# Altium project Fliptris.PrjPcb
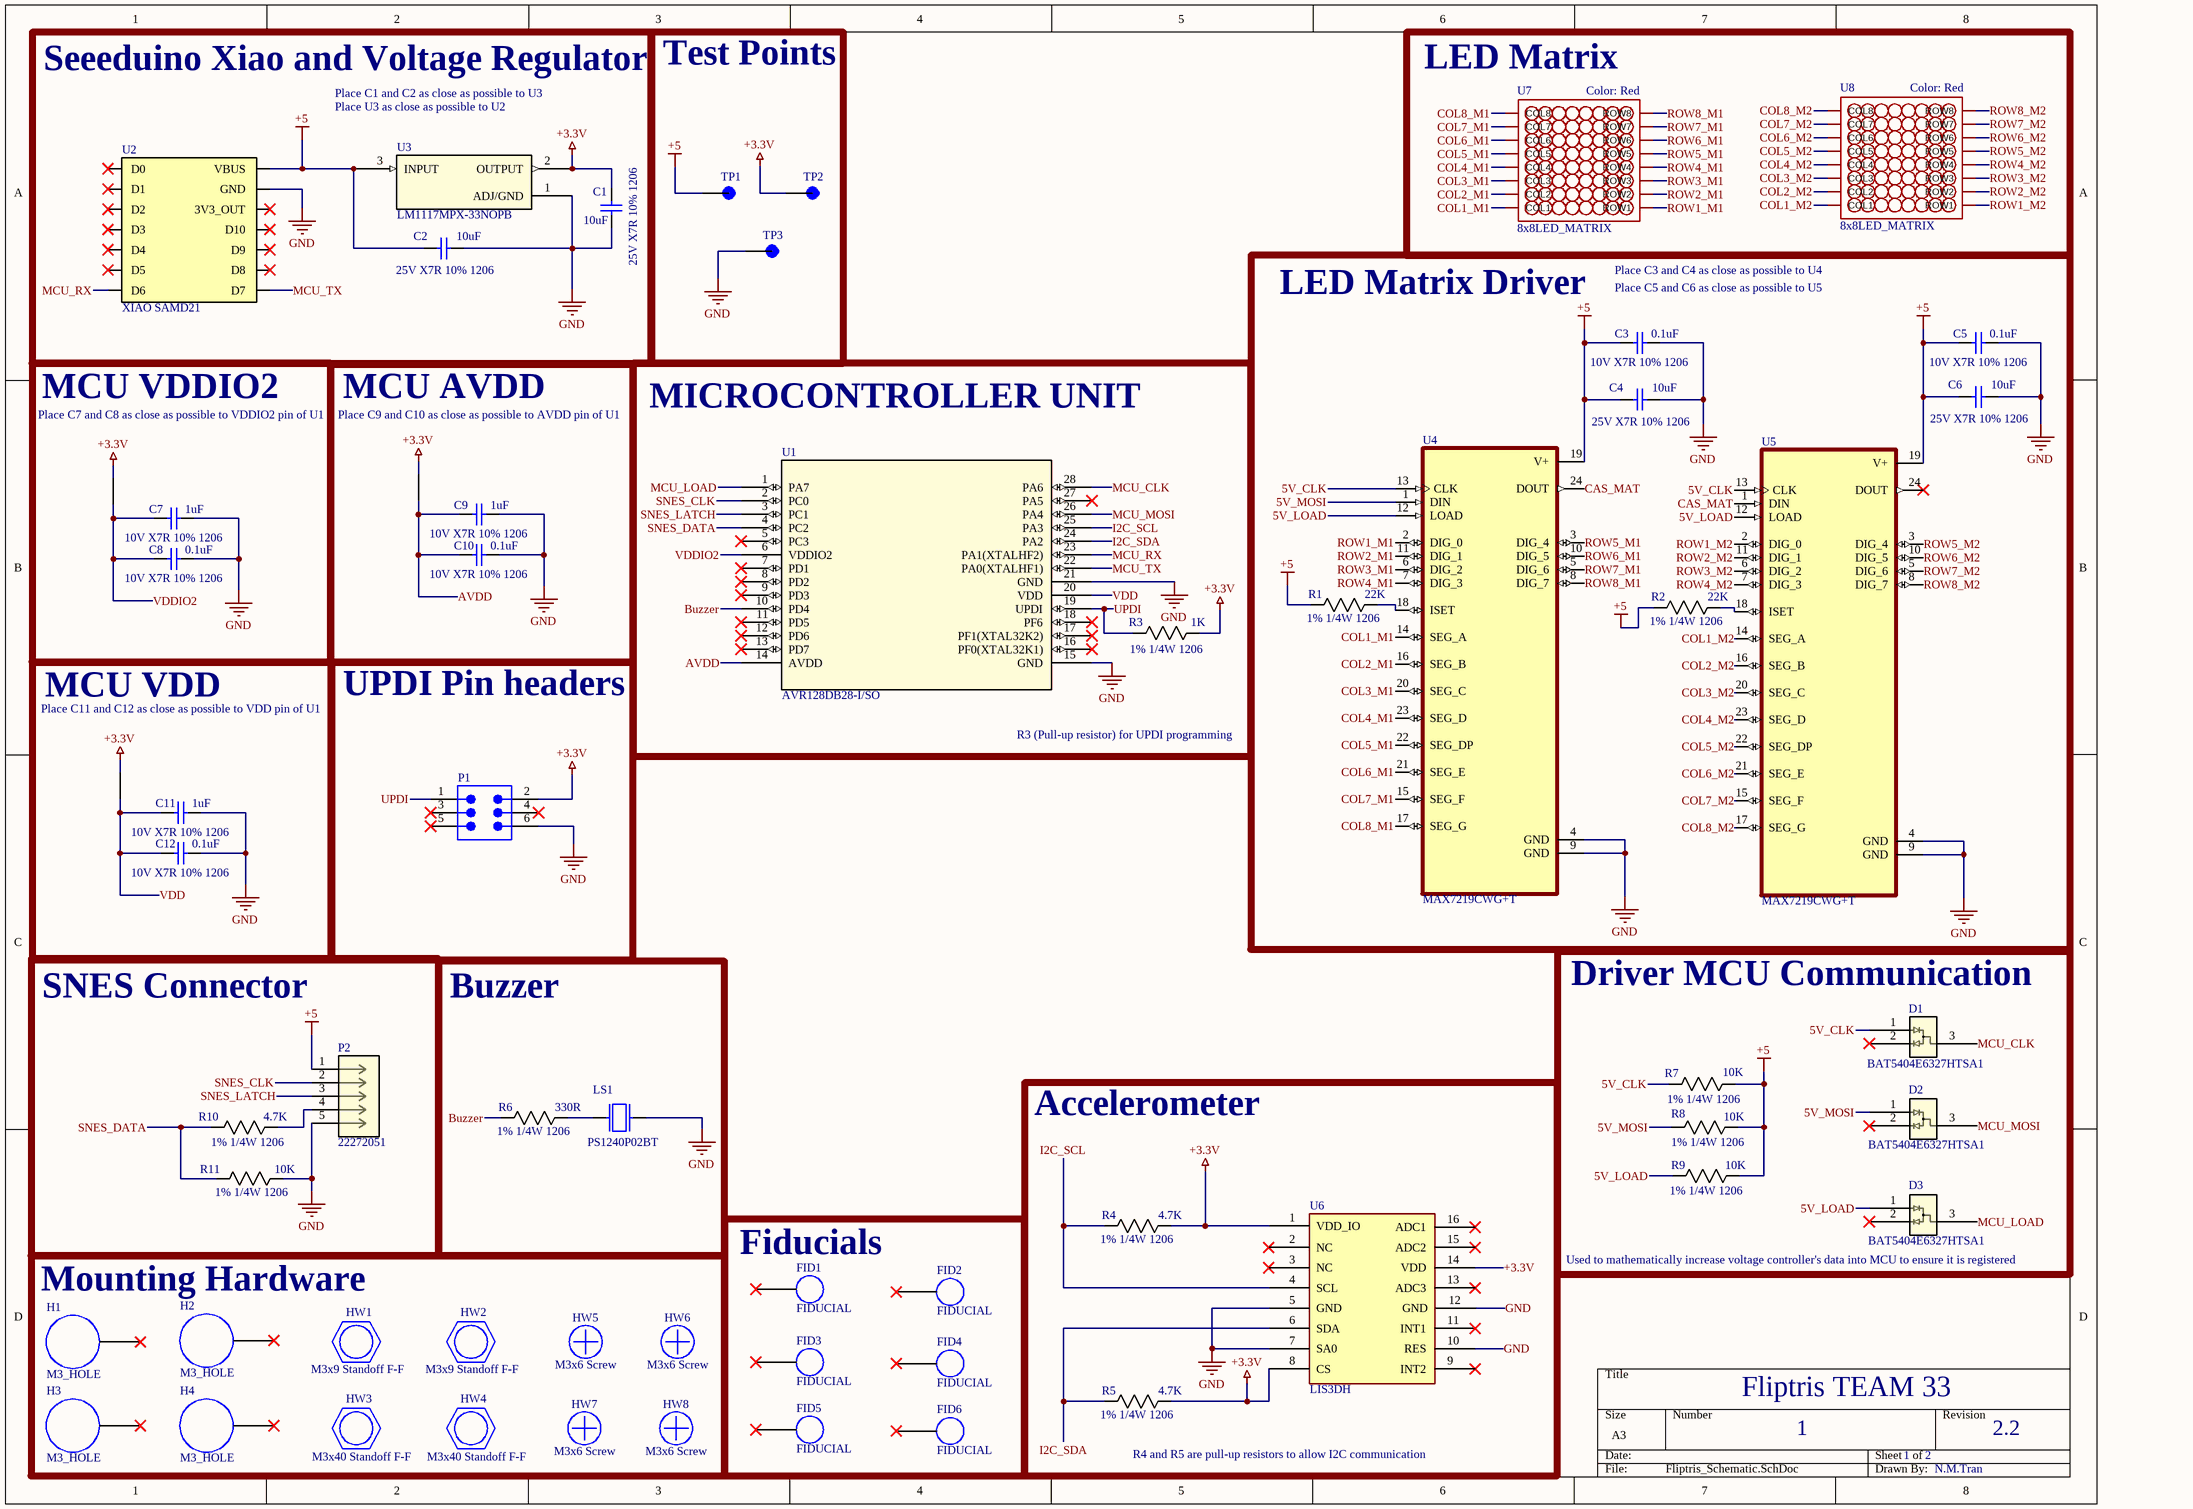
[diagram p0: Fliptris_Schematic.SchDoc]
2 sheets, 61 parts. Net scope: global (net labels, ports and power ports of the same name join across sheets).
Board file: Fliptris_PCB.PcbDoc
Sheets:
  Fliptris_Schematic.SchDoc
  Fliptris_Schematic2.SchDoc

## Sheet Fliptris_Schematic.SchDoc
size A3; SheetNumber: 1; SheetTotal: 1

### Parts
C1  25V X7R 10% 1206  value 10uF  [WCAP-CSGP_1206_L3.2W1.6H0.8]
C2  25V X7R 10% 1206  value 10uF  [WCAP-CSGP_1206_L3.2W1.6H0.8]
C3  10V X7R 10% 1206  value 0.1uF  [WCAP-CSGP_1206_L3.2W1.6H0.8]
C4  25V X7R 10% 1206  value 10uF  [WCAP-CSGP_1206_L3.2W1.6H0.8]
C5  10V X7R 10% 1206  value 0.1uF  [WCAP-CSGP_1206_L3.2W1.6H0.8]
C6  25V X7R 10% 1206  value 10uF  [WCAP-CSGP_1206_L3.2W1.6H0.8]
C7  10V X7R 10% 1206  value 1uF  [WCAP-CSGP_1206_L3.2W1.6H0.8]
C8  10V X7R 10% 1206  value 0.1uF  [WCAP-CSGP_1206_L3.2W1.6H0.8]
C9  10V X7R 10% 1206  value 1uF  [WCAP-CSGP_1206_L3.2W1.6H0.8]
C10  10V X7R 10% 1206  value 0.1uF  [WCAP-CSGP_1206_L3.2W1.6H0.8]
C11  10V X7R 10% 1206  value 1uF  [WCAP-CSGP_1206_L3.2W1.6H0.8]
C12  10V X7R 10% 1206  value 0.1uF  [WCAP-CSGP_1206_L3.2W1.6H0.8]
D1  BAT5404E6327HTSA1  [SOT23_INF]
D2  BAT5404E6327HTSA1  [SOT23_INF]
D3  BAT5404E6327HTSA1  [SOT23_INF]
FID1  FIDUCIAL  [FIDUCIAL_1.5MM]
FID2  FIDUCIAL  [FIDUCIAL_1.5MM]
FID3  FIDUCIAL  [FIDUCIAL_1.5MM]
FID4  FIDUCIAL  [FIDUCIAL_1.5MM]
FID5  FIDUCIAL  [FIDUCIAL_1.5MM]
FID6  FIDUCIAL  [FIDUCIAL_1.5MM]
H1  M3_HOLE  [M3_MOUNTING_HOLE]
H2  M3_HOLE  [M3_MOUNTING_HOLE]
H3  M3_HOLE  [M3_MOUNTING_HOLE]
H4  M3_HOLE  [M3_MOUNTING_HOLE]
HW1  M3x9 Standoff F-F
HW2  M3x9 Standoff F-F
HW3  M3x40 Standoff F-F
HW4  M3x40 Standoff F-F
HW5  M3x6 Screw
HW6  M3x6 Screw
HW7  M3x6 Screw
HW8  M3x6 Screw
LS1  PS1240P02BT  [XDCR_PS1240P02BT]
N1  NET_TIE  [NET_TIE]  (value not drawn)  (net tie, no BOM)
N2  NET_TIE  [NET_TIE]  (value not drawn)  (net tie, no BOM)
N3  NET_TIE  [NET_TIE]  (value not drawn)  (net tie, no BOM)
P1  61200621621  [61200621621]  (value not drawn)
P2  22272051  [CONN_AE-6410-05A_MOL]
R1  1% 1/4W 1206  value 22K  [Universal resistor SMD]
R2  1% 1/4W 1206  value 22K  [Universal resistor SMD]
R3  1% 1/4W 1206  value 1K  [Universal resistor SMD]
R4  1% 1/4W 1206  value 4.7K  [Universal resistor SMD]
R5  1% 1/4W 1206  value 4.7K  [Universal resistor SMD]
R6  1% 1/4W 1206  value 330R  [Universal resistor SMD]
R7  1% 1/4W 1206  value 10K  [Universal resistor SMD]
R8  1% 1/4W 1206  value 10K  [Universal resistor SMD]
R9  1% 1/4W 1206  value 10K  [Universal resistor SMD]
R10  1% 1/4W 1206  value 4.7K  [Universal resistor SMD]
R11  1% 1/4W 1206  value 10K  [Universal resistor SMD]
TP1  5010  [TP_5010]  (value not drawn)
TP2  5014  [TP_5014]  (value not drawn)
TP3  5011  [TP_5011]  (value not drawn)
U1  AVR128DB28-I/SO  [SOIC28_SO_MCH]
U2  XIAO SAMD21  [XIAO-14P-Add-On]
U3  LM1117MPX-33NOPB  [SOT223-318H_OSI]
U4  MAX7219CWG+T  [SOIC127P1032X265-24N]
U5  MAX7219CWG+T  [SOIC127P1032X265-24N]
U6  LIS3DH  [LIS3DH]
U7  8x8LED_MATRIX  [8x8LED_MATRIX]
U8  8x8LED_MATRIX  [8x8LED_MATRIX]

### Blocks framed on the sheet
Seeeduino Xiao and Voltage Regulator: C1 C2 U2 U3
Test Points: TP1-TP3
LED Matrix: U7 U8
LED Matrix Driver: C3-C6 R1 R2 U4 U5
MCU VDDIO2: C7 C8 N2
MCU AVDD: C9 C10 N1
MICROCONTROLLER UNIT: R3 U1
MCU VDD: C11 C12 N3
UPDI Pin headers: P1
SNES Connector: P2 R10 R11
Buzzer: LS1 R6
Driver MCU Communication: D1-D3 R7-R9
Accelerometer: R4 R5 U6
Mounting Hardware: H1-H4 HW1-HW8
Fiducials: FID1-FID6

### Nets
+3.3V: C1.1 N1.N1(NET_TIE) N2.N1(NET_TIE) N3.N1(NET_TIE) P1.2 R3.1 R4.1 R5.1 TP2.TP U3.2(OUTPUT) U6.1(VDD_IO) U6.8(CS) U6.14(VDD)
+5: C2.1 C3.1 C4.1 C5.1 C6.1 P2.1 R1.2 R2.2 R7.1 R8.1 R9.1 TP1.TP U2.14(VBUS) U3.3(INPUT) U4.19(V+) U5.19(V+)
GND: C1.2 C2.2 C3.2 C4.2 C5.2 C6.2 C7.2 C8.2 C9.2 C10.2 C11.2 C12.2 LS1.2 P1.6 P2.5 R11.1 TP3.TP U1.15(GND) U1.21(GND) U2.13(GND) U3.1(ADJ/GND) U4.4(GND) U4.9(GND) U5.4(GND) U5.9(GND) U6.5(GND) U6.7(SA0) U6.10(RES) U6.12(GND)
5V_CLK: D1.1 R7.2 U4.13(CLK) U5.13(CLK)
5V_LOAD: D3.1 R9.2 U4.12(LOAD) U5.12(LOAD)
5V_MOSI: D2.1 R8.2 U4.1(DIN)
AVDD: C9.1 C10.1 N1.N2(NET_TIE) U1.14(AVDD)
Buzzer: R6.2 U1.10(PD4)
CAS_MAT: U4.24(DOUT) U5.1(DIN)
COL1_M1: U4.14(SEG_A) U7.13(COL1)
COL1_M2: U5.14(SEG_A) U8.13(COL1)
COL2_M1: U4.16(SEG_B) U7.3(COL2)
COL2_M2: U5.16(SEG_B) U8.3(COL2)
COL3_M1: U4.20(SEG_C) U7.4(COL3)
COL3_M2: U5.20(SEG_C) U8.4(COL3)
COL4_M1: U4.23(SEG_D) U7.10(COL4)
COL4_M2: U5.23(SEG_D) U8.10(COL4)
COL5_M1: U4.22(SEG_DP) U7.6(COL5)
COL5_M2: U5.22(SEG_DP) U8.6(COL5)
COL6_M1: U4.21(SEG_E) U7.11(COL6)
COL6_M2: U5.21(SEG_E) U8.11(COL6)
COL7_M1: U4.15(SEG_F) U7.15(COL7)
COL7_M2: U5.15(SEG_F) U8.15(COL7)
COL8_M1: U4.17(SEG_G) U7.16(COL8)
COL8_M2: U5.17(SEG_G) U8.16(COL8)
I2C_SCL: R4.2 U1.25(PA3) U6.4(SCL)
I2C_SDA: R5.2 U1.24(PA2) U6.6(SDA)
MCU_CLK: D1.3 U1.28(PA6)
MCU_LOAD: D3.3 U1.1(PA7)
MCU_MOSI: D2.3 U1.26(PA4)
MCU_RX: U1.23(PA1(XTALHF2)) U2.7(D6)
MCU_TX: U1.22(PA0(XTALHF1)) U2.8(D7)
ROW1_M1: U4.2(DIG_0) U7.9(ROW1)
ROW1_M2: U5.2(DIG_0) U8.9(ROW1)
ROW2_M1: U4.11(DIG_1) U7.14(ROW2)
ROW2_M2: U5.11(DIG_1) U8.14(ROW2)
ROW3_M1: U4.6(DIG_2) U7.8(ROW3)
ROW3_M2: U5.6(DIG_2) U8.8(ROW3)
ROW4_M1: U4.7(DIG_3) U7.12(ROW4)
ROW4_M2: U5.7(DIG_3) U8.12(ROW4)
ROW5_M1: U4.3(DIG_4) U7.1(ROW5)
ROW5_M2: U5.3(DIG_4) U8.1(ROW5)
ROW6_M1: U4.10(DIG_5) U7.7(ROW6)
ROW6_M2: U5.10(DIG_5) U8.7(ROW6)
ROW7_M1: U4.5(DIG_6) U7.2(ROW7)
ROW7_M2: U5.5(DIG_6) U8.2(ROW7)
ROW8_M1: U4.8(DIG_7) U7.5(ROW8)
ROW8_M2: U5.8(DIG_7) U8.5(ROW8)
SNES_CLK: P2.2 U1.2(PC0)
SNES_DATA: R10.2 R11.2 U1.4(PC2)
SNES_LATCH: P2.3 U1.3(PC1)
UPDI: P1.1 R3.2 U1.19(UPDI)
VDD: C11.1 C12.1 N3.N2(NET_TIE) U1.20(VDD)
VDDIO2: C7.1 C8.1 N2.N2(NET_TIE) U1.6(VDDIO2)
NetLS1_1: LS1.1 R6.1
NetP2_4: P2.4 R10.1
NetR1_1: R1.1 U4.18(ISET)
NetR2_1: R2.1 U5.18(ISET)

Not connected (* = marked no-connect by the designer): D1 2*; D2 2*; D3 2*; FID1 1(FIDUCIAL)*; FID2 1(FIDUCIAL)*; FID3 1(FIDUCIAL)*; FID4 1(FIDUCIAL)*; FID5 1(FIDUCIAL)*; FID6 1(FIDUCIAL)*; H1 1(M3_MOUNTING_HOLE)*; H2 1(M3_MOUNTING_HOLE)*; H3 1(M3_MOUNTING_HOLE)*; H4 1(M3_MOUNTING_HOLE)*; P1 3* 4* 5*; U1 5(PC3)* 7(PD1)* 8(PD2)* 9(PD3)* 11(PD5)* 12(PD6)* 13(PD7)* 16(PF0(XTAL32K1))* 17(PF1(XTAL32K2))* 18(PF6)* 27(PA5)*; U2 1(D0)* 2(D1)* 3(D2)* 4(D3)* 5(D4)* 6(D5)* 9(D8)* 10(D9)* 11(D10)* 12(3V3_OUT)*; U5 24(DOUT)*; U6 2(NC)* 3(NC)* 9(INT2)* 11(INT1)* 13(ADC3)* 15(ADC2)* 16(ADC1)*

### Notes on the sheet
- Place C1 and C2 as close as possible to U3
- Place U3 as close as possible to U2
- (near U7) Color: Red
- (near U8) Color: Red
- Place C3 and C4 as close as possible to U4
- Place C5 and C6 as close as possible to U5
- Place C7 and C8 as close as possible to VDDIO2 pin of U1
- Place C9 and C10 as close as possible to AVDD pin of U1
- Place C11 and C12 as close as possible to VDD pin of U1
- R3 (Pull-up resistor) for UPDI programming
- (near D3) Used to mathematically increase voltage controller's data into MCU to ensure it is registered
- (near R5) R4 and R5 are pull-up resistors to allow I2C communication
- Fliptris TEAM 33
- 1
- 2
- 2.2
- N.M.Tran

### Library data of the parts
C1 C2 C4 C6 = CMP-03913-65419883-2: Cap Ceramic uF 10V X7R 10% Pad SMD 1206; Case/Package: 1206; Manufacturer: *; Manufacturer Product Number: *
C3 C5 C8 C10 C12 = CMP-03913-65419883-2: Cap Ceramic 0.1uF 10V X7R 10% Pad SMD 1206; Manufacturer: Würth Elektronik; Manufacturer Product Number: 885012208009; Case/Package: 1206
C7 C9 C11 = CMP-03913-65419883-2: Cap Ceramic 1uF 10V X7R 10% Pad SMD 1206; Manufacturer: Würth Elektronik; Manufacturer Product Number: 885012208013; Case/Package: 1206
D1-D3 = BAT5404E6327HTSA1: Silicon Schottky Diode; Manufacturer_Name: Infineon; Type: Diodes - Rectifiers, Arrays; Copyright: Copyright (C) 2025 Ultra Librarian. All rights reserved.; Manufacturer_Part_Number: BAT5404E6327HTSA1; RefDes: RefDes
HW1-HW4 = Standoff
HW5-HW8 = Screw
LS1 = PS1240P02BT: Buzzers Transducer, Externally Driven Piezo 3V 4kHz 60dB @ 3V, 10cm Through Hole PC Pins; MF: TDK; MP: PS1240P02BT; Availability: Unavailable; Package: 2020 TDK; Value: *; Price: None; SnapEDA_Link: https://www.snapeda.com/parts/PS1240P02BT/TDK/view-part/53420/?ref=snap
P1 = CMP-1502-00000-3: Conn Shrouded Header (4 Sides) M 6 POS 2.54mm Solder ST Top Entry Thru-Hole Tray; Operating Supply Voltage: 250V; Connector Type: Male Pin; Gender: Male; Insulation Resistance: 1GΩ; Number of Contacts: 6; Current Rating: 3A; Contact Resistance: 20mΩ; RoHS: Compliant; Contact Material: Copper; Row Spacing: 2.54mm; Color: Black; Contact Plating: Gold; Termination: Solder; Number of Pins: 6; Number of Rows: 2; Min Operating Temperature: -40°C; Max Operating Temperature: 105°C; Mount: Through Hole; Lead Pitch: 2.54mm; Number of Positions: 6; Pitch: 2.54mm; Insulation Material: PBT; Orientation: Vertical; Length: 15.28mm
P2 = 22272051: KK 254 Wire-to-Board Header, Vertical, with Friction Lock, 5 Circuits, Tin (Sn) Plating; Manufacturer_Name: Molex Connector Corporation; Copyright: Copyright (C) 2025 Ultra Librarian. All rights reserved.; Manufacturer_Part_Number: 22272051; RefDes: RefDes; Type: Type
R1-R11 = Universal resistor SMD: Resistor SMD 1206; Manufacturer: *; Manufacturer Product Number: *; Case/Package: 1206
TP1 = 5010: Test Point MultiPurpose THM .445 L .125 OD Heat Resistant Nylon 46 Red | Keystone Electronics 5010; SnapEDA_Link: https://www.snapeda.com/parts/5010/Keystone/view-part/?ref=snap; Package: NON STANDARD-1 Keystone; Value: *; MF: Keystone Electronics; MP: 5010; Check_prices: https://www.snapeda.com/parts/5010/Keystone/view-part/?ref=eda
TP2 = 5014: Test Point MultiPurpose THM H .445 Nylon 46 Insulated Yel PhosBronze/Silver | Keystone Electronics 5014; SnapEDA_Link: https://www.snapeda.com/parts/5014/Keystone/view-part/?ref=snap; Package: None; Value: *; MF: Keystone; MP: 5014; Check_prices: https://www.snapeda.com/parts/5014/Keystone/view-part/?ref=eda
TP3 = 5011: Test Point MultiPurpose THM H .445 Nylon 46 Insulated Blk PhosBronze/Silver | Keystone Electronics 5011; MF: Keystone Electronics Corp.; SnapEDA_Link: https://www.snapeda.com/parts/5011/Keystone/view-part/?ref=snap; Package: None; Value: *; MP: 5011; Check_prices: https://www.snapeda.com/parts/5011/Keystone/view-part/?ref=eda
U1 = AVR128DB28-ISO: No Description Available; Manufacturer_Name: Microchip; Copyright: Copyright (C) 2026 Ultra Librarian. All rights reserved.; Manufacturer_Part_Number: AVR128DB28-I/SO; RefDes: RefDes; Type: Type
U2 = XIAO-Add-On: Value: XIAO-Add-On; Footprint: Seeed_Studio_XIAO_Series:XIAO-14P-Add-On
U3 = LM1117MPX-33NOPB: Description; Manufacturer_Name: onsemi; Copyright: Copyright (C) 2025 Ultra Librarian. All rights reserved.; Manufacturer_Part_Number: LM1117MPX-33NOPB; RefDes: RefDes; Type: Type
U4 U5 = MAX7219CWG+T: LED Driver 64 Segment 330000uA Supply Current 24-Pin SOIC W T/R; MF: Maxim Integrated Products; SnapEDA_Link: https://www.snapeda.com/parts/MAX7219CWG+T/Maxim+Integrated/view-part/?ref=snap; Package: None; Value: *; MP: MAX7219CWG+T; Check_prices: https://www.snapeda.com/parts/MAX7219CWG+T/Maxim+Integrated/view-part/?ref=eda

## Sheet Fliptris_Schematic2.SchDoc
size A3
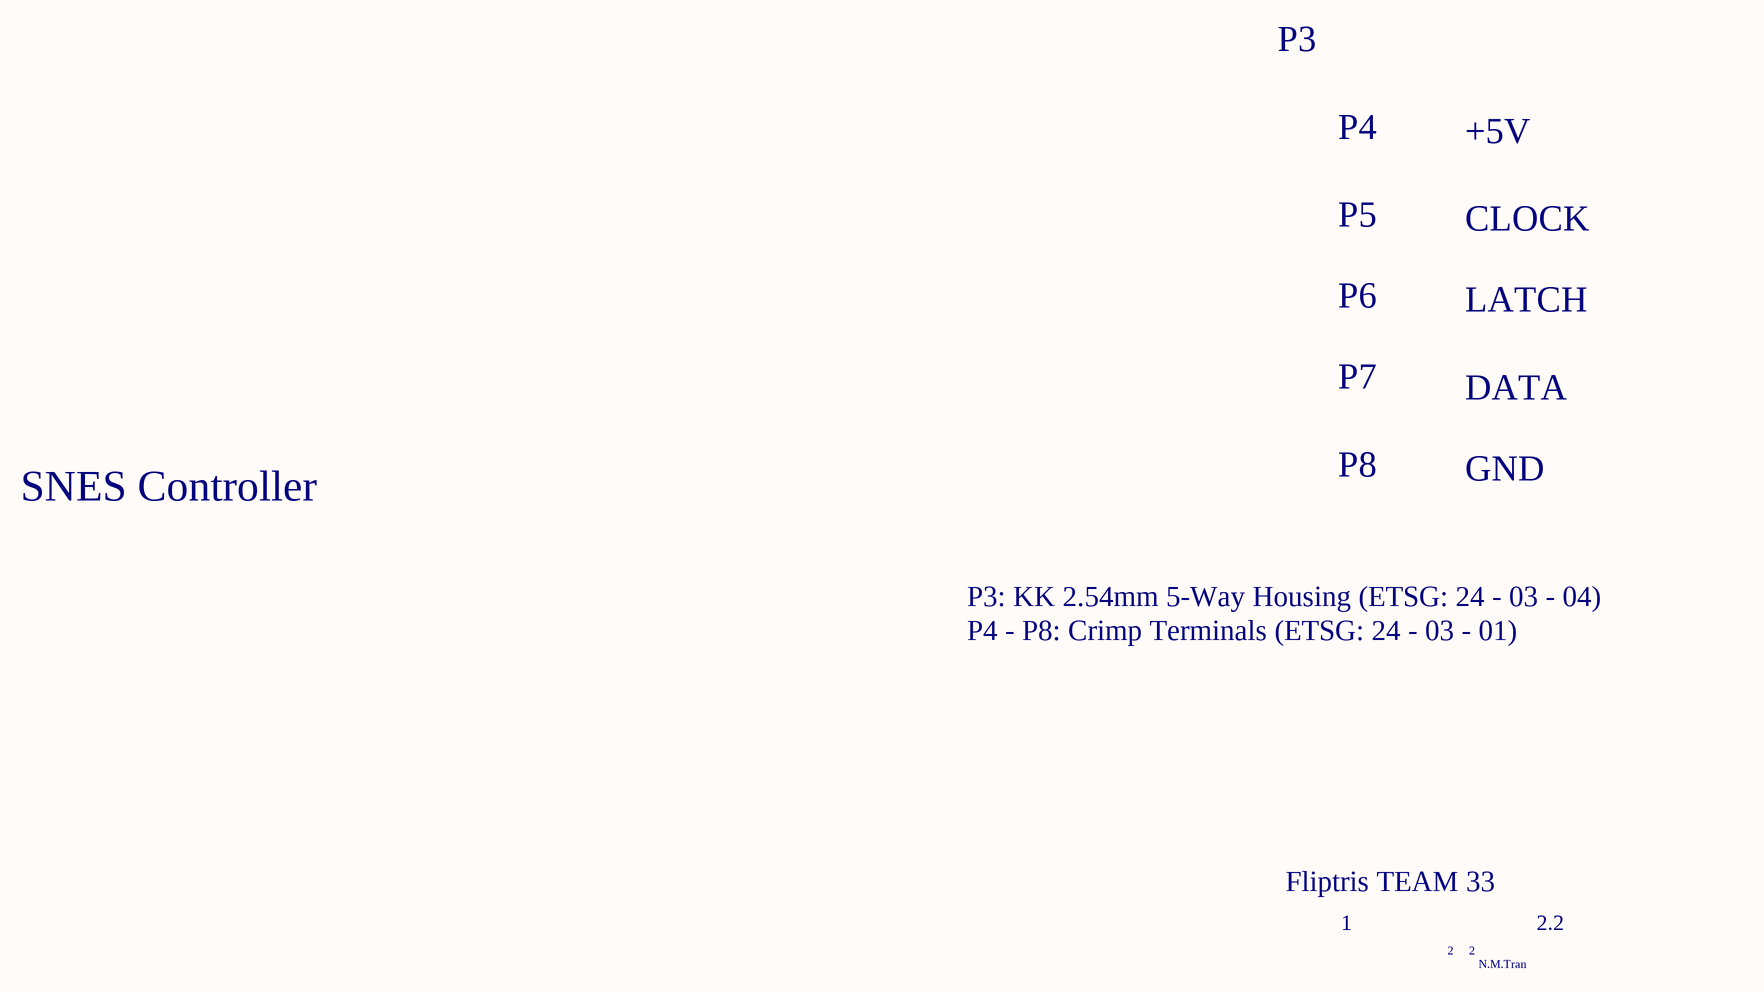
[diagram p1: Fliptris_Schematic2.SchDoc]

### Notes on the sheet
- P3
- P4
- +5V
- P5
- CLOCK
- P6
- LATCH
- P7
- DATA
- P8
- GND
- SNES Controller
- P3: KK 2.54mm 5-Way Housing (ETSG: 24 - 03 - 04)
- P4 - P8: Crimp Terminals (ETSG: 24 - 03 - 01)
- Fliptris TEAM 33
- 1
- 2
- 2.2
- N.M.Tran